# Altium schematic sheet 3.uC Peripheral.SchDoc: TopLevel Schematic
size A3; Date: 21/11/16; Author: Daijun; Revision: 2.0; SheetNumber: 3; SheetTotal: 4; Size: A4; Contact: 0731-88731029; ProjectName: EVM
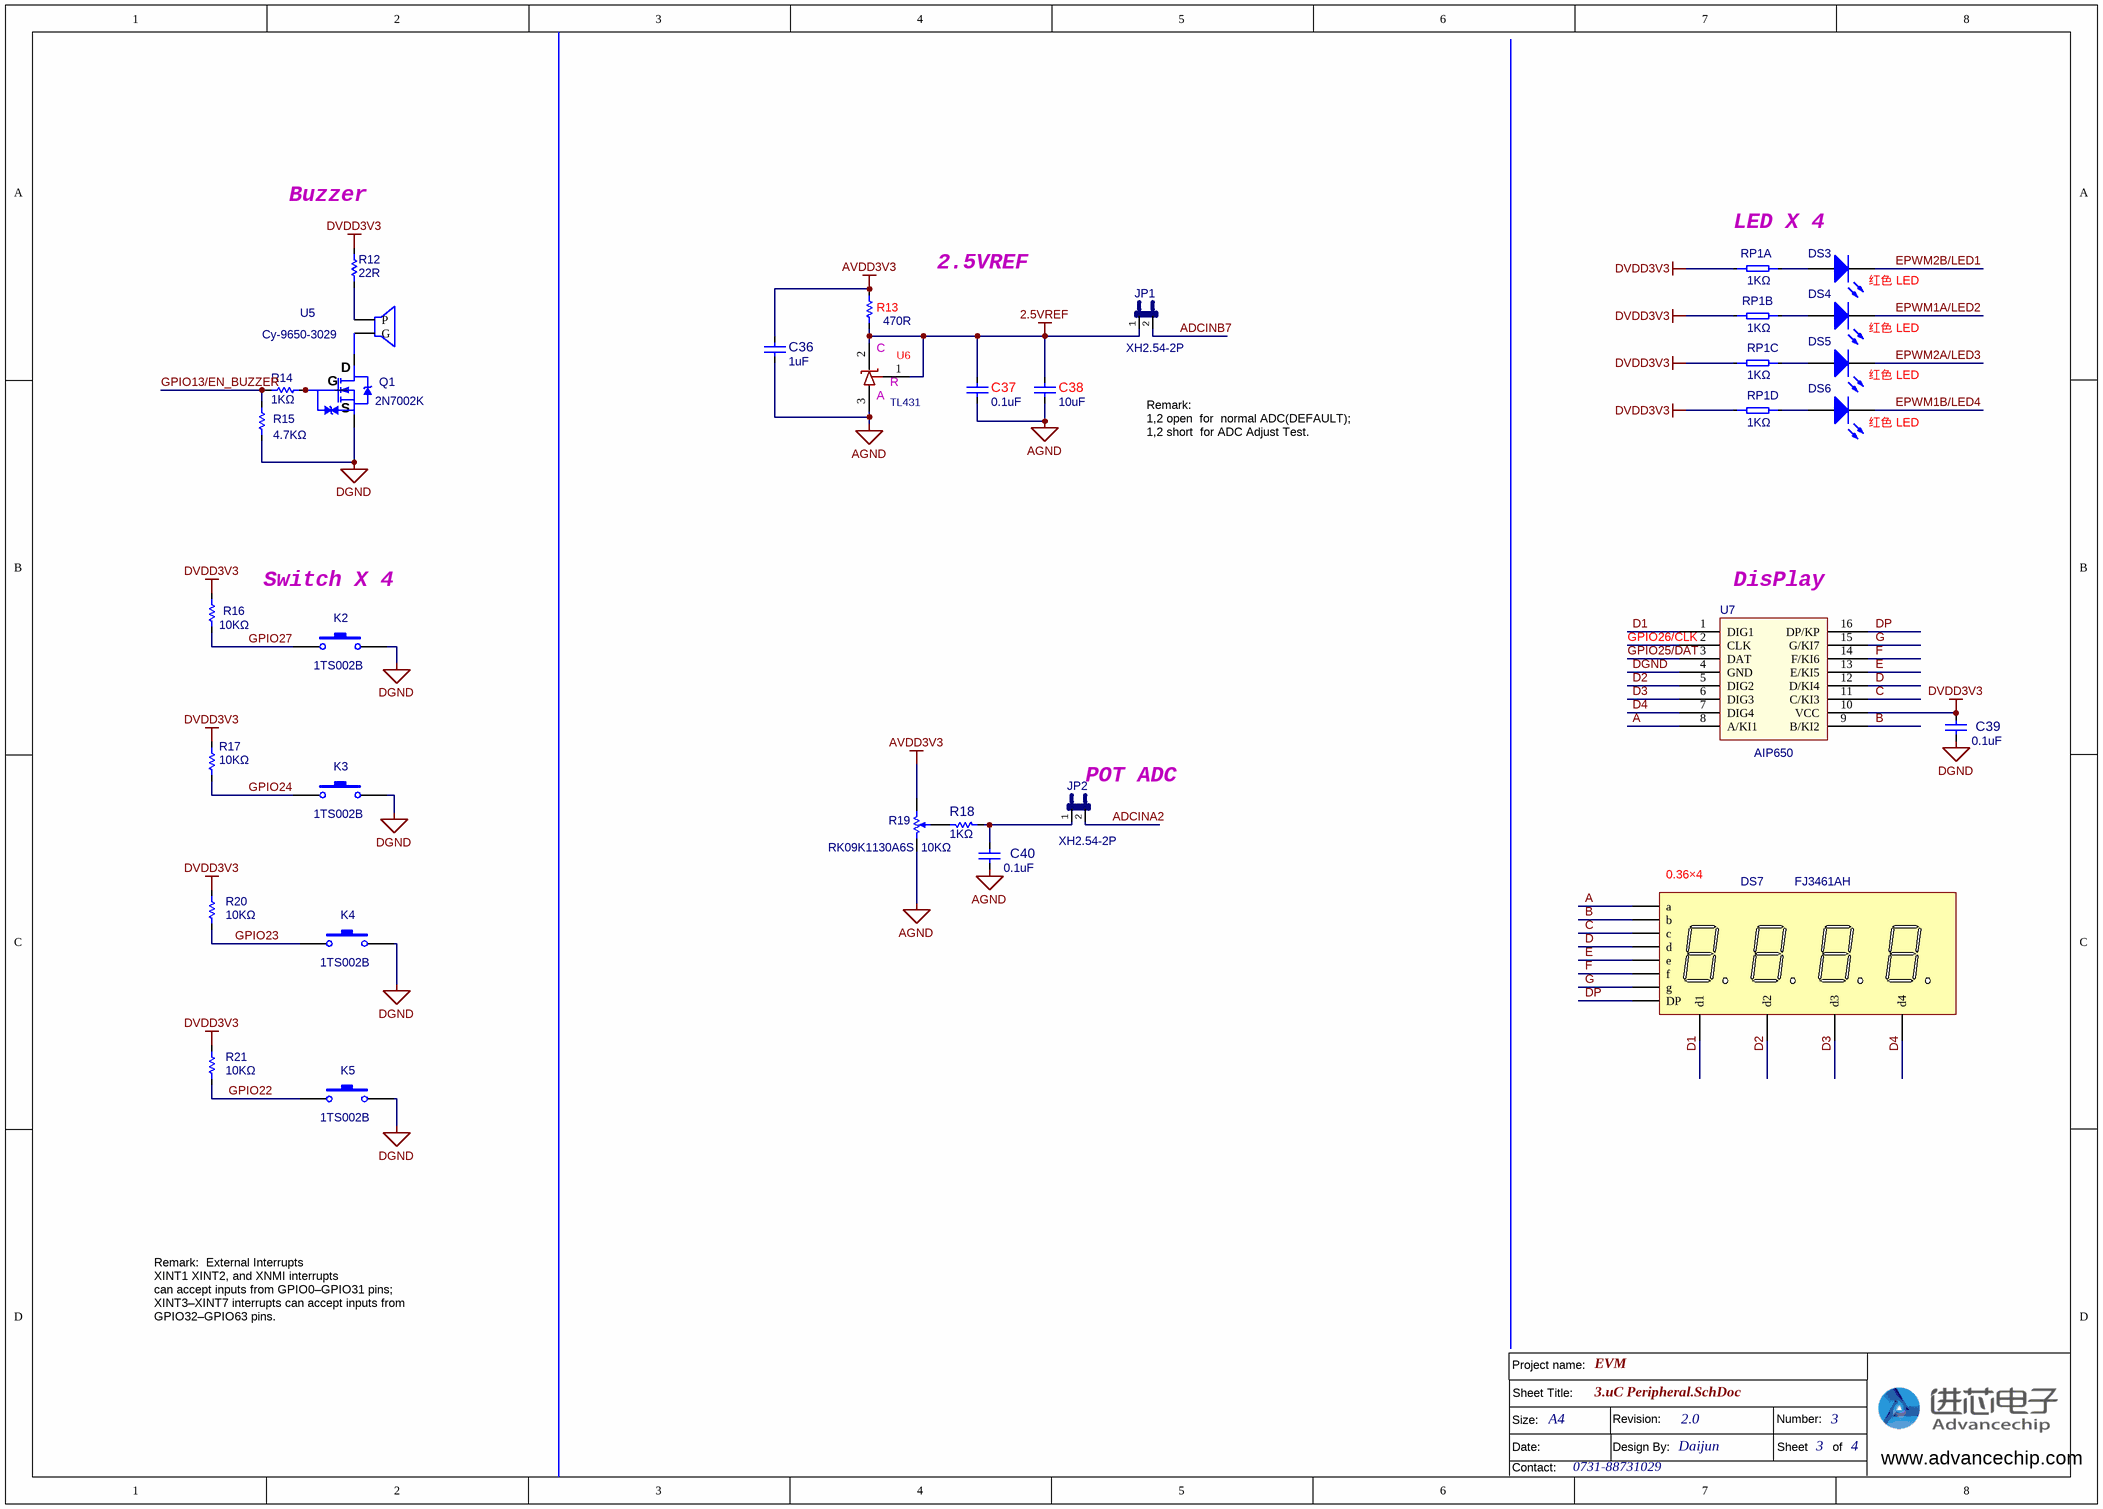
[diagram p0: 3.uC Peripheral.SchDoc]

## Parts
C36  value 1uF  [0603CX]  (hidden comment: 1uF/25V)
C37  value 0.1uF  [0603CX]  (hidden comment: 0.1uF/50V)
C38  value 10uF  [C0805]  (hidden comment: 10uF/10V)
C39  value 0.1uF  [0603CX]  (hidden comment: 0.1uF/50V)
C40  value 0.1uF  [0603CX]  (hidden comment: 0.1uF/50V)
DS3  红色 LED  [SMD_LED0805_LED]
DS4  红色 LED  [SMD_LED0805_LED]
DS5  红色 LED  [SMD_LED0805_LED]
DS6  红色 LED  [SMD_LED0805_LED]
DS7  FJ3461AH  value 0.36×4  [0.36X4]
JP1  XH2.54-2P  [SIP2C]
JP2  XH2.54-2P  [SIP2C]
K2  value 1TS002B  [SW-3X6]  (hidden comment: 1TS002B-2400-5001-CT)
K3  value 1TS002B  [SW-3X6]  (hidden comment: 1TS002B-2400-5001-CT)
K4  value 1TS002B  [SW-3X6]  (hidden comment: 1TS002B-2400-5001-CT)
K5  value 1TS002B  [SW-3X6]  (hidden comment: 1TS002B-2400-5001-CT)
Q1  2N7002K  [MOS-SOT23]
R12  22R  [1206RX]
R13  470R  [0603RX]
R14  1KΩ  [0603RX]
R15  4.7KΩ  [0603RX]
R16  10KΩ  [R0603]
R17  10KΩ  [R0603]
R18  1KΩ  [0603RX]
R19  RK09K1130A6S  10KΩ  [RK09K1130]
R20  10KΩ  [R0603]
R21  10KΩ  [R0603]
RP1  1KΩ  [0603Rx_4P]  (parts A,B,C,D of 4)
U5  Cy-9650-3029  [SUN-0905-3V]
U6  TL431  [SOT-23]
U7  AIP650  [SOIC-16_150mil]

## Nets
2.5VREF: C37.1 C38.1 JP1.1 R13.2 U6.1(R) U6.2(C)
AGND: C36.2 C37.2 C38.2 C40.2 R19.1 U6.3(A)
AVDD3V3: C36.1 R13.1 R19.3
DGND: C39.2 K2.2 K3.2 K4.2 K5.2 Q1.S R15.2 U7.4(GND)
DVDD3V3: C39.1 R12.1 R16.1 R17.1 R20.1 R21.1 RP1.1 RP1.2 RP1.3 RP1.4 U7.10(VCC)
A: DS7.a U7.8(A/KI1)
ADCINA2: JP2.2
ADCINB7: JP1.2
B: DS7.b U7.9(B/KI2)
C: DS7.c U7.11(C/KI3)
D: DS7.d U7.12(D/KI4)
D1: DS7.com1(d1) U7.1(DIG1)
D2: DS7.com2(d2) U7.5(DIG2)
D3: DS7.com3(d3) U7.6(DIG3)
D4: DS7.com4(d4) U7.7(DIG4)
DP: DS7.dp(DP) U7.16(DP/KP)
E: DS7.e U7.13(E/KI5)
EPWM1A/LED2: DS4.2(K)
EPWM1B/LED4: DS6.2(K)
EPWM2A/LED3: DS5.2(K)
EPWM2B/LED1: DS3.2(K)
F: DS7.f U7.14(F/KI6)
G: DS7.g U7.15(G/KI7)
GPIO13/EN_BUZZER: R14.2 R15.1
GPIO22: K5.1 R21.2
GPIO23: K4.1 R20.2
GPIO24: K3.1 R17.2
GPIO25/DAT: U7.3(DAT)
GPIO26/CLK: U7.2(CLK)
GPIO27: K2.1 R16.2
NetC40_1: C40.1 JP2.1 R18.2
NetDS3_1: DS3.1(A) RP1.8
NetDS4_1: DS4.1(A) RP1.7
NetDS5_1: DS5.1(A) RP1.6
NetDS6_1: DS6.1(A) RP1.5
NetQ1_D: Q1.D U5.2(G)
NetQ1_G: Q1.G R14.1
NetR12_2: R12.2 U5.1(P)
NetR18_1: R18.1 R19.2

## Notes on the sheet
- (near R12) Buzzer
- LED X 4
- 2.5VREF
- Remark:
  1,2 open  for  normal ADC(DEFAULT);
  1,2 short  for ADC Adjust Test.
- Switch X 4
- (near U7) DisPlay
- (near JP2) POT ADC
- Remark:  External Interrupts
  XINT1 XINT2, and XNMI interrupts
  can accept inputs from GPIO0–GPIO31 pins;
  XINT3–XINT7 interrupts can accept inputs from
  GPIO32–GPIO63 pins.
- Sheet Title:
- Project name:
- Size:
- Date:
- Contact:
- Revision:
- Design By:
- Number:
- Sheet       of
- www.advancechip.com

## Library data of the parts
C36-C40 = Cap: 贴片电容; Published: 8-Jun-2000; LatestRevisionDate: 17-Jul-2002; LatestRevisionNote: Re-released for DXP Platform.; Publisher: Altium Limited
DS3-DS6 = LED0: 发光二极管; Published: 8-Jun-2000; LatestRevisionDate: 08-Jul-2005; LatestRevisionNote: Mech Layer 1 removed.; PackageReference: LED-0; Publisher: Altium Limited; PackageDescription: LED; 2 Leads
DS7 = Dpy Amber-4K: 4位0.36英寸红色共阴七段数码管; 焊接类型: 直插; ComponentLink1URL: *; ComponentLink2Description: *; ComponentLink2URL: *; ComponentLink3Description: *; ComponentLink3URL: *; Pin: 12
JP1 JP2 = JP2: 连接器+跳线帽
K2-K5 = SW-PB: 鸿源精密轻触开关3X6; Published: 24-Mar-1999; LatestRevisionDate: 17-Jul-2002; LatestRevisionNote: Re-released for DXP Platform.; Publisher: Altium Limited
Q1 = 2SK3019: N-MOSFET 60V300mA低开启电压; Published: 8-Jun-2000; LatestRevisionDate: 17-Jul-2002; LatestRevisionNote: Re-released for DXP Platform.; Publisher: Altium Limited
R12 R14-R18 R20 R21 = Res: 贴片电阻; Value: 1K; Published: 8-Jun-2000; LatestRevisionDate: 17-Jul-2002; LatestRevisionNote: Re-released for DXP Platform.; Publisher: Altium Limited
R13 = Res: 贴片电阻; Temperature Coefficient: 100ppm/ ℃; Tolerance: 1%; Voltage Rating: 75V; Power Rating: 1/10W; Operating Temperature Range: -55~+125℃; Category: 贴片电阻; PackageReference: 0603; Composition: Thick Film; MountType: Surface Mount (SMD - SMT); RoHS: Y; Supplier 2: 1; Storage Room  Code: 000000
R19 = RPot SM: 立式可调电位器; Published: 17-Dec-2003; DatasheetDocument: Oct-2003; Publisher: Altium Limited
RP1 = Res Pack3: 贴片排阻; Value: 1K; Published: 24-Mar-1999; LatestRevisionDate: 17-Jul-2002; LatestRevisionNote: Re-released for DXP Platform.; Publisher: Altium Limited; Code_JEDEC: MO-150-AC
U5 = BEEP: 超音V有源蜂鸣器 电磁式 脚距5,外径9.5mm
U6 = AZ431AN-ATRE1: 2.5V基准芯片 0.5%, 1R,2C,3A; spiceSymbolName: https://item.szlcsc.com/192500.html
U7 = AIP650E: 无锡中微LED驱动芯片